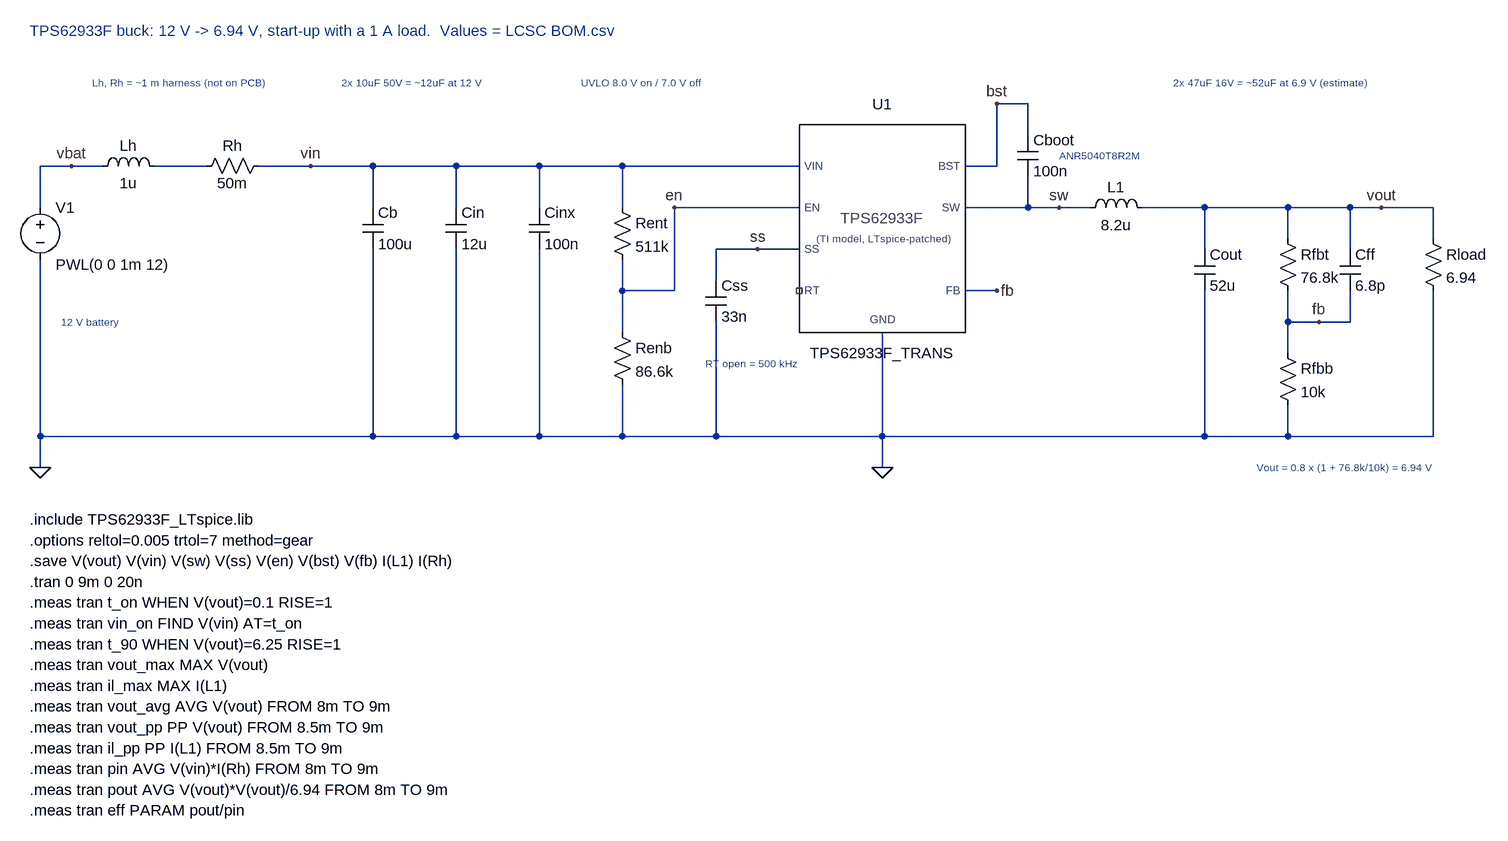
[diagram p0: schematic buck_startup.asc]
buck_startup.asc, the LTspice schematic file:
Version 4.1
SHEET 1 2400 1400
WIRE 64 368 64 304
WIRE 64 304 112 304
WIRE 112 304 160 304
WIRE 240 304 320 304
WIRE 400 304 480 304
WIRE 480 304 576 304
WIRE 576 304 704 304
WIRE 704 304 832 304
WIRE 832 304 960 304
WIRE 960 304 1232 304
WIRE 576 304 576 368
WIRE 576 432 576 720
WIRE 704 304 704 368
WIRE 704 432 704 720
WIRE 832 304 832 368
WIRE 832 432 832 720
WIRE 960 304 960 368
WIRE 960 448 960 496
WIRE 960 496 960 560
WIRE 960 640 960 720
WIRE 960 496 1040 496
WIRE 1040 496 1040 368
WIRE 1040 368 1232 368
WIRE 1232 432 1168 432
WIRE 1168 432 1104 432
WIRE 1104 432 1104 480
WIRE 1104 544 1104 720
WIRE 1360 560 1360 720
WIRE 1488 304 1536 304
WIRE 1536 304 1536 208
WIRE 1536 208 1584 208
WIRE 1584 208 1584 256
WIRE 1584 320 1584 368
WIRE 1488 368 1584 368
WIRE 1584 368 1632 368
WIRE 1632 368 1680 368
WIRE 1760 368 1856 368
WIRE 1856 368 1984 368
WIRE 1984 368 2080 368
WIRE 2080 368 2128 368
WIRE 2128 368 2208 368
WIRE 1856 368 1856 432
WIRE 1856 496 1856 720
WIRE 1984 368 1984 416
WIRE 2080 368 2080 432
WIRE 1984 496 1984 544
WIRE 1984 544 1984 592
WIRE 2080 496 2080 544
WIRE 1984 544 2032 544
WIRE 2032 544 2080 544
WIRE 1984 672 1984 720
WIRE 1488 496 1536 496
WIRE 2208 368 2208 416
WIRE 2208 496 2208 720
WIRE 64 448 64 720
WIRE 64 720 576 720
WIRE 576 720 704 720
WIRE 704 720 832 720
WIRE 832 720 960 720
WIRE 960 720 1104 720
WIRE 1104 720 1360 720
WIRE 1360 720 1856 720
WIRE 1856 720 1984 720
WIRE 1984 720 2208 720
WIRE 64 720 64 768
WIRE 1360 720 1360 768
FLAG 112 304 vbat
FLAG 480 304 vin
FLAG 1040 368 en
FLAG 1168 432 ss
FLAG 1536 208 bst
FLAG 1632 368 sw
FLAG 2128 368 vout
FLAG 2032 544 fb
FLAG 1536 496 fb
FLAG 64 768 0
FLAG 1360 768 0
SYMBOL voltage 64 352 R0
WINDOW 3 24 104 Left 2
SYMATTR InstName V1
SYMATTR Value PWL(0 0 1m 12)
SYMBOL ind 144 320 R270
WINDOW 0 32 56 VTop 2
WINDOW 3 5 56 VBottom 2
SYMATTR InstName Lh
SYMATTR Value 1u
SYMBOL res 304 320 R270
WINDOW 0 32 56 VTop 2
WINDOW 3 5 56 VBottom 2
SYMATTR InstName Rh
SYMATTR Value 50m
SYMBOL cap 560 368 R0
SYMATTR InstName Cb
SYMATTR Value 100u
SYMATTR SpiceLine Rser=0.3
SYMBOL cap 688 368 R0
SYMATTR InstName Cin
SYMATTR Value 12u
SYMATTR SpiceLine Rser=3m
SYMBOL cap 816 368 R0
SYMATTR InstName Cinx
SYMATTR Value 100n
SYMBOL res 944 352 R0
SYMATTR InstName Rent
SYMATTR Value 511k
SYMBOL res 944 544 R0
SYMATTR InstName Renb
SYMATTR Value 86.6k
SYMBOL cap 1088 480 R0
SYMATTR InstName Css
SYMATTR Value 33n
SYMBOL TPS62933F 1360 400 R0
SYMATTR InstName U1
SYMBOL cap 1568 256 R0
SYMATTR InstName Cboot
SYMATTR Value 100n
SYMBOL ind 1664 384 R270
WINDOW 0 32 56 VTop 2
WINDOW 3 5 56 VBottom 2
SYMATTR InstName L1
SYMATTR Value 8.2u
SYMATTR SpiceLine Rser=83m
SYMBOL cap 1840 432 R0
SYMATTR InstName Cout
SYMATTR Value 52u
SYMATTR SpiceLine Rser=1.5m
SYMBOL res 1968 400 R0
SYMATTR InstName Rfbt
SYMATTR Value 76.8k
SYMBOL cap 2064 432 R0
SYMATTR InstName Cff
SYMATTR Value 6.8p
SYMBOL res 1968 576 R0
SYMATTR InstName Rfbb
SYMATTR Value 10k
SYMBOL res 2192 400 R0
SYMATTR InstName Rload
SYMATTR Value 6.94
TEXT 1088 608 Left 1 ;RT open = 500 kHz
TEXT 96 544 Left 1 ;12 V battery
TEXT 144 176 Left 1 ;Lh, Rh = ~1 m harness (not on PCB)
TEXT 528 176 Left 1 ;2x 10uF 50V = ~12uF at 12 V
TEXT 896 176 Left 1 ;UVLO 8.0 V on / 7.0 V off
TEXT 1632 288 Left 1 ;ANR5040T8R2M
TEXT 1808 176 Left 1 ;2x 47uF 16V = ~52uF at 6.9 V (estimate)
TEXT 1936 768 Left 1 ;Vout = 0.8 x (1 + 76.8k/10k) = 6.94 V
TEXT 48 96 Left 2 ;TPS62933F buck: 12 V -> 6.94 V, start-up with a 1 A load.  Values = LCSC BOM.csv
TEXT 48 848 Left 2 !.include TPS62933F_LTspice.lib
TEXT 48 880 Left 2 !.options reltol=0.005 trtol=7 method=gear
TEXT 48 912 Left 2 !.save V(vout) V(vin) V(sw) V(ss) V(en) V(bst) V(fb) I(L1) I(Rh)
TEXT 48 944 Left 2 !.tran 0 9m 0 20n
TEXT 48 976 Left 2 !.meas tran t_on WHEN V(vout)=0.1 RISE=1
TEXT 48 1008 Left 2 !.meas tran vin_on FIND V(vin) AT=t_on
TEXT 48 1040 Left 2 !.meas tran t_90 WHEN V(vout)=6.25 RISE=1
TEXT 48 1072 Left 2 !.meas tran vout_max MAX V(vout)
TEXT 48 1104 Left 2 !.meas tran il_max MAX I(L1)
TEXT 48 1136 Left 2 !.meas tran vout_avg AVG V(vout) FROM 8m TO 9m
TEXT 48 1168 Left 2 !.meas tran vout_pp PP V(vout) FROM 8.5m TO 9m
TEXT 48 1200 Left 2 !.meas tran il_pp PP I(L1) FROM 8.5m TO 9m
TEXT 48 1232 Left 2 !.meas tran pin AVG V(vin)*I(Rh) FROM 8m TO 9m
TEXT 48 1264 Left 2 !.meas tran pout AVG V(vout)*V(vout)/6.94 FROM 8m TO 9m
TEXT 48 1296 Left 2 !.meas tran eff PARAM pout/pin

The netlist it stands for:
* buck_startup.asc
V1 vbat 0 PWL(0 0 1m 12)
Lh vbat N001 1u
Rh N001 vin 50m
Cb vin 0 100u Rser=0.3
Cin vin 0 12u Rser=3m
Cinx vin 0 100n
Rent vin en 511k
Renb en 0 86.6k
Css ss 0 33n
X§U1 bst en fb 0 NC_01 ss sw vin TPS62933F_TRANS  ; pins BST EN FB GND RT SS SW VIN
Cboot bst sw 100n
L1 sw vout 8.2u Rser=83m
Cout vout 0 52u Rser=1.5m
Rfbt vout fb 76.8k
Cff vout fb 6.8p
Rfbb fb 0 10k
Rload vout 0 6.94
* RT open = 500 kHz
* 12 V battery
* Lh, Rh = ~1 m harness (not on PCB)
* 2x 10uF 50V = ~12uF at 12 V
* UVLO 8.0 V on / 7.0 V off
* ANR5040T8R2M
* 2x 47uF 16V = ~52uF at 6.9 V (estimate)
* Vout = 0.8 x (1 + 76.8k/10k) = 6.94 V
* TPS62933F buck: 12 V -> 6.94 V, start-up with a 1 A load.  Values = LCSC BOM.csv
.include TPS62933F_LTspice.lib
.options reltol=0.005 trtol=7 method=gear
.save V(vout) V(vin) V(sw) V(ss) V(en) V(bst) V(fb) I(L1) I(Rh)
.tran 0 9m 0 20n
.meas tran t_on WHEN V(vout)=0.1 RISE=1
.meas tran vin_on FIND V(vin) AT=t_on
.meas tran t_90 WHEN V(vout)=6.25 RISE=1
.meas tran vout_max MAX V(vout)
.meas tran il_max MAX I(L1)
.meas tran vout_avg AVG V(vout) FROM 8m TO 9m
.meas tran vout_pp PP V(vout) FROM 8.5m TO 9m
.meas tran il_pp PP I(L1) FROM 8.5m TO 9m
.meas tran pin AVG V(vin)*I(Rh) FROM 8m TO 9m
.meas tran pout AVG V(vout)*V(vout)/6.94 FROM 8m TO 9m
.meas tran eff PARAM pout/pin
.backanno
.end